# Altium schematic sheet LED_Section.SchDoc
size 420 x 297 mm; DocumentNumber: 14; SheetNumber: 14; SheetTotal: 17
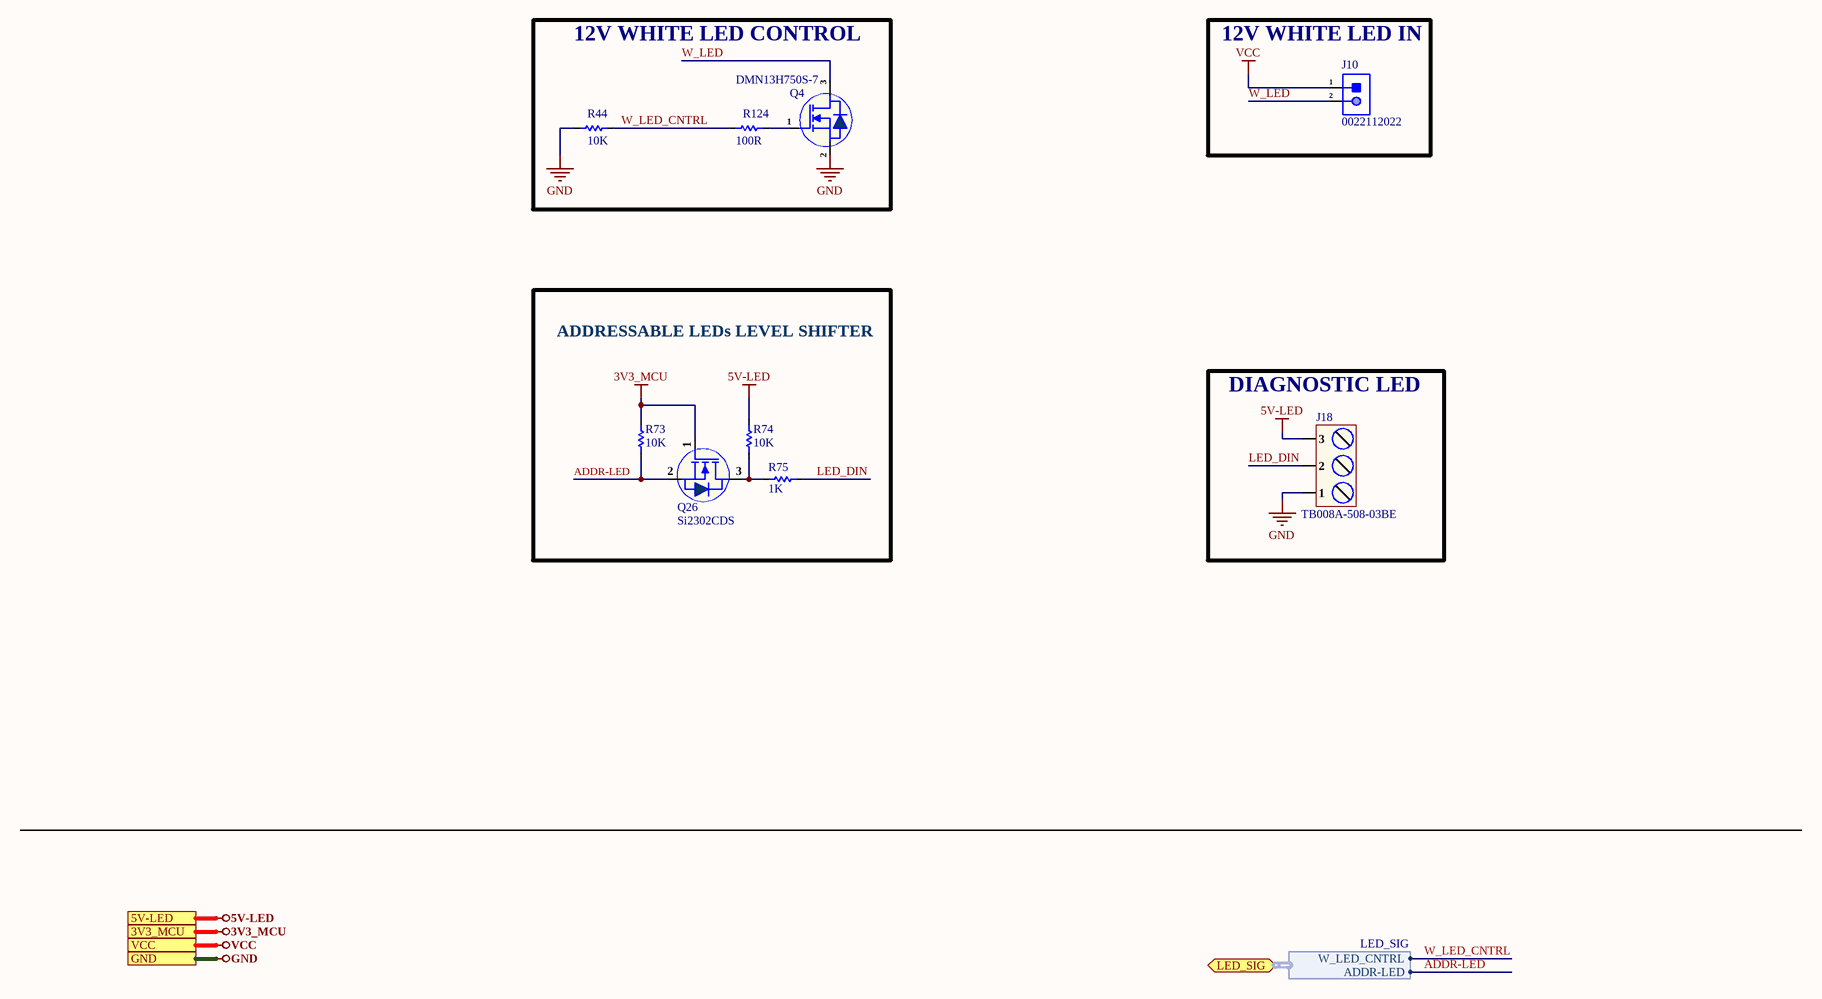
[diagram p0: LED_Section.SchDoc]

## Parts
J10  0022112022  [0022112022]
J18  TB008A-508-03BE  [TB008A-508-03BE]
Q4  DMN13H750S-7  [SOT-23]
Q26  Si2302CDS  [Sot-23]
R44  10K  [Res-0603]
R73  10K  [Res-0402]
R74  10K  [Res-0402]
R75  1K  [Res-0603]
R124  100R  [Res-0603]

## Blocks framed on the sheet
12V WHITE LED CONTROL: Q4 R44 R124
12V WHITE LED IN: J10
ADDRESSABLE LEDs LEVEL SHIFTER: Q26 R73-R75
DIAGNOSTIC LED: J18

## Ports
3V3_MCU, 5V-LED, GND, LED_SIG (bidir, harness LED_SIG), VCC

## Harnesses
LED_SIG: ADDR-LED, W_LED_CNTRL

## Nets
3V3_MCU: Q26.1(G) R73.1 ; port 3V3_MCU
5V-LED: J18.3 R74.1 ; port 5V-LED
GND: J18.1 Q4.2(S) R44.1 ; port GND
VCC: J10.1 ; port VCC
ADDR-LED: Q26.2(S) R73.2 ; port LED_SIG.ADDR-LED
LED_DIN: J18.2 R75.2
W_LED: J10.2 Q4.3(D)
W_LED_CNTRL: R44.2 R124.1 ; port LED_SIG.W_LED_CNTRL
NetQ4_1: Q4.1(G) R124.2
NetQ26_3: Q26.3(D) R74.2 R75.1

## Notes on the sheet
- File:
- Title:
- Date:
- Page
- Num:
- Total:
- Drawn By: Huzaifa Ali

## Library data of the parts
J10 = 0022112022: CONN HEADER VERT 2POS 2.54MM; Manufacturer: Molex; Item Type: Headers, Male Pins; Supplier: Mouser; Supplier Part Number: 538-22-11-2022; Manufacturer Part Number: 0022112022; RoHS: Yes; Stock: 67872; Pricing: 1=0.4, 10=0.274, 50=0.274, 100=0.216, 1000=0.177, 10000=0.169 (USD); ComponentLink1URL: https://www.molex.com/pdm_docs/sd/022112022_sd.pdf?src-supplier=Digikey; ComponentLink1Description: https://www.molex.com/pdm_docs/sd/022112022_sd.pdf?src-supplier=Digikey; LCSC Part Number: C505162
J18 = TB008A-508-03BE: TERMINAL BLOCK, SCREW TYPE, 5.08; Manufacturer: Same Sky; Item Type: Terminal Blocks; Approvals: CE, IEC, UL, cUL; Current Rating: 16A; Number of Contacts: 3; Number of Levels: 1; Pitch: 5.08mm; Voltage Rating: 300V; Wire/Cable Gauge: 12AWG; Supplier: DigiKey; Supplier Part Number: 102-6214-ND; Manufacturer Part Number: TB008A-508-03BE; RoHS: Compliant; Stock: 16509; Pricing: 1=0.88, 10=0.646, 25=0.5624, 50=0.5068, 100=0.4587, 250=0.40648, 800=0.35708, 1600=0.33523, 5600=0.30675 (USD); Color: Blue; Height: 15.82mm; Lifecycle Status: Production; Max Operating Temperature: 105°C; Min Operating Temperature: -40°C; Mounting Technology: Screw; Number of Rows: 1; Width: 13.89mm; ComponentLink1URL: https://datasheet.octopart.com:443/TB008A-508-03BE-Same-Sky-datasheet-181920260.pdf?src-supplier=Same+Sky; ComponentLink1Description: https://datasheet.octopart.com:443/TB008A-508-03BE-Same-Sky-datasheet-181920260.pdf?src-supplier=Same+Sky; ComponentLink2URL: https://datasheet.octopart.com:443/TB008A-508-03BE-CUI-Devices-datasheet-175928141.pdf?src-supplier=Same+Sky; ComponentLink2Description: https://datasheet.octopart.com:443/TB008A-508-03BE-CUI-Devices-datasheet-175928141.pdf?src-supplier=Same+Sky; ComponentLink3URL: https://datasheet.octopart.com:443/TB008A-508-03BE-CUI-Devices-datasheet-144794964.pdf?src-supplier=Same+Sky; ComponentLink3Description: https://datasheet.octopart.com:443/TB008A-508-03BE-CUI-Devices-datasheet-144794964.pdf?src-supplier=Same+Sky; ComponentLink4URL: https://datasheet.octopart.com:443/TB008A-508-03BE-CUI-Devices-datasheet-180438533.pdf?src-supplier=IHS; ComponentLink4Description: https://datasheet.octopart.com:443/TB008A-508-03BE-CUI-Devices-datasheet-180438533.pdf?src-supplier=IHS; ComponentLink5URL: https://datasheet.octopart.com:443/TB008A-508-03BE-Same-Sky-datasheet-182881448.pdf?src-supplier=Electro+Sonic; ComponentLink5Description: https://datasheet.octopart.com:443/TB008A-508-03BE-Same-Sky-datasheet-182881448.pdf?src-supplier=Electro+Sonic; ComponentLink6URL: https://datasheet.octopart.com:443/TB008A-508-03BE-CUI-Devices-datasheet-154730749.pdf?src-supplier=Electro+Sonic; ComponentLink6Description: https://datasheet.octopart.com:443/TB008A-508-03BE-CUI-Devices-datasheet-154730749.pdf?src-supplier=Electro+Sonic; ComponentLink7URL: https://datasheet.octopart.com:443/TB008A-508-03BE-Same-Sky-datasheet-182050257.pdf?src-supplier=Future+Electronics; ComponentLink7Description: https://datasheet.octopart.com:443/TB008A-508-03BE-Same-Sky-datasheet-182050257.pdf?src-supplier=Future+Electronics; ComponentLink8URL: https://datasheet.octopart.com:443/TB008A-508-03BE-CUI-Devices-datasheet-175927974.pdf?src-supplier=CUI+Devices+SCT; ComponentLink8Description: https://datasheet.octopart.com:443/TB008A-508-03BE-CUI-Devices-datasheet-175927974.pdf?src-supplier=CUI+Devices+SCT; ComponentLink9URL: https://datasheet.octopart.com:443/TB008A-508-03BE-CUI-Devices-datasheet-142371924.pdf?src-supplier=CUI+Devices+SCT; ComponentLink9Description: https://datasheet.octopart.com:443/TB008A-508-03BE-CUI-Devices-datasheet-142371924.pdf?src-supplier=CUI+Devices+SCT; ComponentLink10URL: https://octopart.com:443/opatz8j6/c1?t=0rrj9xZvWnV357ApMC44QDMfuFQOynKpDDkNDVK0ahZLtLs4EP94JWsSV65SUkEP0h5KCd_75-IqVeGeieU7iHhVKoVGG_ST2MghvEpmPJJ9UwSaEZlWiAicsgfGzyF6p2K7XALTRwBG0Ty4NiqOExgubdlPVcXLSurspFP3-kkStU3AXD7cVH-wG37lyG-DMiy0SjRNsbn3p3EEcBKBnHJR4FcTeCr9kuJyRmp0FirPwd5r7ApjQGrAVbySJS4dG70ZpeJlDibjpeCbOjvVoVjF_GpDk4_zPnX3kvvewE3aS3sxHdEwY7nG3-liKoGc8vQOYvj7q83gsACr679Us3Zzk60XfasVTe-rguoy&src-supplier=Compliance+Statements; ComponentLink10Description: https://octopart.com:443/opatz8j6/c1?t=0rrj9xZvWnV357ApMC44QDMfuFQOynKpDDkNDVK0ahZLtLs4EP94JWsSV65SUkEP0h5KCd_75-IqVeGeieU7iHhVKoVGG_ST2MghvEpmPJJ9UwSaEZlWiAicsgfGzyF6p2K7XALTRwBG0Ty4NiqOExgubdlPVcXLSurspFP3-kkStU3AXD7cVH-wG37lyG-DMiy0SjRNsbn3p3EEcBKBnHJR4FcTeCr9kuJyRmp0FirPwd5r7ApjQGrAVbySJS4dG70ZpeJlDibjpeCbOjvVoVjF_GpDk4_zPnX3kvvewE3aS3sxHdEwY7nG3-liKoGc8vQOYvj7q83gsACr679Us3Zzk60XfasVTe-rguoy&src-supplier=Compliance+Statements; ComponentLink11URL: https://octopart.com:443/opatz8j6/c1?t=QS2-Fn7cVgScLTi3gc2amca8hkcDZURPxy_ufMpeWk7uDUOdZkBCM46dERNIiGtSLWu2wlNRTRepa-5uYmvtZcTDBcRMj_nqdKYMuQtHO2A9XO5ZFvN9gYSVnieHinURU49v_SsHn50d_2pstAo6QmU6vYWW3cDtDfPq0v_nUK0JS9qffyN9Fg9TL0Vgxr7HkZJEWT4c7sY1BjN1ed2EPEv_llxnI4pfCrS9yqvKD-CsnhCPh-IFUypFb3nwWXrNmBrlKIj7KynvaUzKgM_siwj2SFGWog8hEoQA4AvTYP1Xr6oPuMWRsc8wW1c5tie0zdhqU94a6qk1TN0BgFfGzjlF53KmXw7CvFlzBL4ehZm6sg&src-supplier=Compliance+Statements; ComponentLink11Description: https://octopart.com:443/opatz8j6/c1?t=QS2-Fn7cVgScLTi3gc2amca8hkcDZURPxy_ufMpeWk7uDUOdZkBCM46dERNIiGtSLWu2wlNRTRepa-5uYmvtZcTDBcRMj_nqdKYMuQtHO2A9XO5ZFvN9gYSVnieHinURU49v_SsHn50d_2pstAo6QmU6vYWW3cDtDfPq0v_nUK0JS9qffyN9Fg9TL0Vgxr7HkZJEWT4c7sY1BjN1ed2EPEv_llxnI4pfCrS9yqvKD-CsnhCPh-IFUypFb3nwWXrNmBrlKIj7KynvaUzKgM_siwj2SFGWog8hEoQA4AvTYP1Xr6oPuMWRsc8wW1c5tie0zdhqU94a6qk1TN0BgFfGzjlF53KmXw7CvFlzBL4ehZm6sg&src-supplier=Compliance+Statements; ComponentLink12URL: https://octopart.com:443/opatz8j6/c1?t=cyoWsWJutaiKY4D4cZoL0JarVp02apWsKQY4NMaC_BE3UJrSc7HgjnBE63-W5Pn3S4_g4vPr15bqLDCh9Kdy1pQHDZsPdGVe6Y17R7O6qne0lGuhCV-OGjIpyeEMzqMXgfQMIjm1O6wLlTAkFYZD2itvYMrtCCtPfYGisoBpRwuOKSv1yQr4oma4_lISgw22SiyJjR_s1lWD_F_4tIiIW_JEvyY1YL8DvhWh7elvZo24VmfoXm02xBN4o6hon_hJ0NPFBKp0gHsFHICkCCvfugy3c62vK1nRV6pqlxkvXj8qYEFwt-V-HKimgzD_l48qCDPECTrxyE5VhV0V4OD2MUAtfA9rF-aDjXbb3Kk4&src-supplier=Compliance+Statements; ComponentLink12Description: https://octopart.com:443/opatz8j6/c1?t=cyoWsWJutaiKY4D4cZoL0JarVp02apWsKQY4NMaC_BE3UJrSc7HgjnBE63-W5Pn3S4_g4vPr15bqLDCh9Kdy1pQHDZsPdGVe6Y17R7O6qne0lGuhCV-OGjIpyeEMzqMXgfQMIjm1O6wLlTAkFYZD2itvYMrtCCtPfYGisoBpRwuOKSv1yQr4oma4_lISgw22SiyJjR_s1lWD_F_4tIiIW_JEvyY1YL8DvhWh7elvZo24VmfoXm02xBN4o6hon_hJ0NPFBKp0gHsFHICkCCvfugy3c62vK1nRV6pqlxkvXj8qYEFwt-V-HKimgzD_l48qCDPECTrxyE5VhV0V4OD2MUAtfA9rF-aDjXbb3Kk4&src-supplier=Compliance+Statements; ComponentLink13URL: https://octopart.com:443/opatz8j6/c1?t=8RiZ5SNhMWXaXunRuWXjRrkE_b-hdCS3ymm5Sp3ae4uMqMsgoglAm7-BokWdzGAZbjUMtMVCNs51B0YlYrbtv79WJFiWtC9ngkNzLFs6rEylWaaKTtmgObrPhEzzoWxuSaEtijQdV5hEKXCF5RCq7ul8L8pfufVaq0s6-bSSR6C0VjpwGz9J1Vm1NeUveBP9k9PQz8XM83TOsrC0krs8t2vDYF5-Plj7lSJMQKYpUs9gso0V1VxvtiA0EiiOXXXqxPBX1Nhh2iSdlSBOUfMvfGOGuL6ftneEugiPJhc8tqAy_YDUVjzciq62IpSvI32od9s84jAfWfTC2oKzUfjFVLX6dTtMUD249xixiYNDTNJnsQ&src-supplier=Compliance+Statements; ComponentLink13Description: https://octopart.com:443/opatz8j6/c1?t=8RiZ5SNhMWXaXunRuWXjRrkE_b-hdCS3ymm5Sp3ae4uMqMsgoglAm7-BokWdzGAZbjUMtMVCNs51B0YlYrbtv79WJFiWtC9ngkNzLFs6rEylWaaKTtmgObrPhEzzoWxuSaEtijQdV5hEKXCF5RCq7ul8L8pfufVaq0s6-bSSR6C0VjpwGz9J1Vm1NeUveBP9k9PQz8XM83TOsrC0krs8t2vDYF5-Plj7lSJMQKYpUs9gso0V1VxvtiA0EiiOXXXqxPBX1Nhh2iSdlSBOUfMvfGOGuL6ftneEugiPJhc8tqAy_YDUVjzciq62IpSvI32od9s84jAfWfTC2oKzUfjFVLX6dTtMUD249xixiYNDTNJnsQ&src-supplier=Compliance+Statements
Q4 = DMN13H750S-7: MOSFET N-CH 130V 1A SOT23; Manufacturer: Diodes Incorporated; Manufacturer Part Number: DMN13H750S-7; Package: SOT-23-3L; LCSC Part Number: C156273; Item Type: Mosfet; ComponentLink1URL: https://www.lcsc.com/product-detail/MOSFETs_Diodes-Incorporated-DMN13H750S-7_C156273.html; ComponentLink1Description: LCSC
Q26 = Si2302CDS: N-CHANNEL 20-V (D-S) MOSFET; Manufacturer: TECH PUBLIC; ComponentLink1Description: LCSC; ComponentLink1URL: https://www.lcsc.com/product-detail/MOSFETs_TECH-PUBLIC-SI2302CDS_C5310968.html; Manufacturer Part Number: SI2302CDS; Package: SOT-23; LCSC Part Number: C5310968; Item Type: Mosfet
R44 = RC0603FR-0710KL: RES SMD 10K Ohm 1% 1/10W 0603; Manufacturer: Yageo; Resistance: 10kR; Temperature Coefficient: 100ppm/°C; Voltage Rating (DC): 50V; Power Rating: 100mW; Voltage Rating: 75V; Item Type: Resistor; Supplier 1: Digi-Key; Manufacturer Part Number: RC0603FR-0710KL; RoHS: Yes; Category: Chip SMD Resistors; Stock 1: 25249139; Pricing 1: 1=0.10000, 10=0.02400, 100=0.00970, 1000=0.00436, 2500=0.00378 (USD); Case/Package: 0603; Number of Pins: 2; Case Code (Imperial): 0603; Case Code (Metric): 1608; Weight: 7.1E-05oz; Size Code: 0603; Min Operating Temperature: -55°C; Max Operating Temperature: 155°C; Tolerance: 1%; Resistor Type: Thick Film; Packaging: Tape and Reel; Termination: SMD/SMT; Features: Moisture Resistant; Series: RC; Max Power Dissipation: 100mW; Number of Terminations: 2; Resistance Tolerance: 1%; Construction: Rectangular; Length: 1.6mm; Width: 0.8mm; Height: 0.45mm; Depth: 0.8mm; Lead Pitch: 0.3mm; REACH SVHC: Unknown; Lead Free: Lead Free; Military Standard: Not; RoHS Compliant: Yes; ComponentLink1URL: https://datasheet.ciiva.com/7660/38590-7660789.pdf?src-supplier=Element14; ComponentLink1Description: https://datasheet.ciiva.com/7660/38590-7660789.pdf?src-supplier=Element14; ComponentLink2URL: https://datasheet.ciiva.com/7983/443971-7983596.pdf?src-supplier=Element14; ComponentLink2Description: https://datasheet.ciiva.com/7983/443971-7983596.pdf?src-supplier=Element14; ComponentLink3URL: https://datasheet.ciiva.com/22747/443971-22747519.pdf?src-supplier=Element14; ComponentLink3Description: https://datasheet.ciiva.com/22747/443971-22747519.pdf?src-supplier=Element14; ComponentLink4URL: https://datasheet.ciiva.com/46440/1868787-46440891.pdf?src-supplier=Element14; ComponentLink4Description: https://datasheet.ciiva.com/46440/1868787-46440891.pdf?src-supplier=Element14; ComponentLink5URL: https://datasheet.ciiva.com/7746/1738695-7746239.pdf?src-supplier=Element14; ComponentLink5Description: https://datasheet.ciiva.com/7746/1738695-7746239.pdf?src-supplier=Element14; ComponentLink6URL: https://datasheet.ciiva.com/15189/getdatasheetpartid-409289-15189591.pdf?src-supplier=Verical; ComponentLink6Description: https://datasheet.ciiva.com/15189/getdatasheetpartid-409289-15189591.pdf?src-supplier=Verical; Supplier Part Number 1: 311-10.0KHRCT-ND; LCSC Part Number: C98220
R73 R74 = RC0402FR-0710KL: RES 10K OHM 1% 1/16W 0402; Manufacturer: Yageo; Resistance: 10kR; Voltage Rating (DC): 50V; Temperature Coefficient: 100ppm/°C; Power Rating: 62.5mW; Max Power Dissipation: 63mW; Item Type: Resistor; Supplier 1: Mouser; Manufacturer Part Number: RC0402FR-0710KL; RoHS: Yes; Category: Chip SMD Resistors; Stock 1: 18648329; Pricing 1: 1=0.10000, 10=0.01400, 50=0.01400, 100=0.00500, 1000=0.00300, 10000=0.00200 (USD); Case/Package: 0402; Number of Pins: 2; Case Code (Imperial): 0402; Case Code (Metric): 1005; Min Operating Temperature: -55°C; Max Operating Temperature: 155°C; Resistor Type: Thick Film; Tolerance: 1%; Packaging: Tape and Reel; Voltage Rating: 50V; Termination: SMD/SMT; Working Voltage: 50V; Number of Terminations: 2; Features: Moisture Resistant; Series: RC; Resistance Tolerance: 1%; Construction: Rectangular; Length: 1mm; Width: 0.5mm; Height: 0.32mm; Depth: 0.5mm; Lead Pitch: 0.2mm; REACH SVHC: No SVHC; Lead Free: Lead Free; RoHS Compliant: Yes; Military Standard: Not; ComponentLink1URL: https://datasheet.ciiva.com/7660/38568-7660787.pdf?src-supplier=Element14; ComponentLink1Description: https://datasheet.ciiva.com/7660/38568-7660787.pdf?src-supplier=Element14; ComponentLink2URL: https://datasheet.ciiva.com/7849/1686128-7849814.pdf?src-supplier=Element14; ComponentLink2Description: https://datasheet.ciiva.com/7849/1686128-7849814.pdf?src-supplier=Element14; ComponentLink3URL: https://datasheet.ciiva.com/7983/1018594-7983486.pdf?src-supplier=Element14; ComponentLink3Description: https://datasheet.ciiva.com/7983/1018594-7983486.pdf?src-supplier=Element14; ComponentLink4URL: https://datasheet.ciiva.com/22747/1018594-22747512.pdf?src-supplier=Element14; ComponentLink4Description: https://datasheet.ciiva.com/22747/1018594-22747512.pdf?src-supplier=Element14; ComponentLink5URL: https://datasheet.ciiva.com/12667/pyu-rc0402-51-rohs-l-6-r-12667067.pdf?src-supplier=Mouser; ComponentLink5Description: https://datasheet.ciiva.com/12667/pyu-rc0402-51-rohs-l-6-r-12667067.pdf?src-supplier=Mouser; ComponentLink6URL: https://datasheet.ciiva.com/7849/1784430-7849813.pdf?src-supplier=Element14; ComponentLink6Description: https://datasheet.ciiva.com/7849/1784430-7849813.pdf?src-supplier=Element14; ComponentLink7URL: https://datasheet.ciiva.com/7849/1784430-7849815.pdf?src-supplier=Element14; ComponentLink7Description: https://datasheet.ciiva.com/7849/1784430-7849815.pdf?src-supplier=Element14; Supplier Part Number 1: 603-RC0402FR-0710KL; LCSC Part Number: C60490
R75 = RC0603FR-071KL: RES SMD 1K OHM 1% 1/10W 0603; Manufacturer: Yageo; Resistance: 1kR; Temperature Coefficient: 100ppm/°C; Power Rating: 100mW; Voltage Rating: 50V; Item type: Resistor; ComponentLink1URL: https://www.verical.com/server-webapp/html/getDatasheet?partID=409289&src-supplier=Verical; ComponentLink1Description: https://www.verical.com/server-webapp/html/getDatasheet?partID=409289&src-supplier=Verical; Supplier 1: Digi-Key; Manufacturer Part Number: RC0603FR-071KL; Stock 1: 21472395; Pricing 1: 1=0.1, 10=0.023, 100=0.0094, 1000=0.0042, 2500=0.0037 (USD); Case/Package: 0603; Contact Plating: Tin,Matte; Case Code (Imperial): 0603; Case Code (Metric): 1608; Min Operating Temperature: -55°C; Max Operating Temperature: 155°C; Tolerance: 1%; Composition: Thick Film; Packaging: Tape and Reel; Termination: SMD/SMT; Military Standard: Not; Length: 1.6mm; Height: 0.45mm; Depth: 0.8mm; Radiation Hardening: No; REACH SVHC: No SVHC; Lead Free: Lead Free; ComponentLink2URL: http://documents.rs-components.com/techlib://itc_doclist_GB.htm?stockno=5048928&src-supplier=RSComponents; ComponentLink2Description: http://documents.rs-components.com/techlib://itc_doclist_GB.htm?stockno=5048928&src-supplier=RSComponents; ComponentLink3URL: http://www.yageo.com/documents/recent/PYu-RC0603_51_RoHS_L_4.pdf?src-supplier=Avnet+Europe; ComponentLink3Description: http://www.yageo.com/documents/recent/PYu-RC0603_51_RoHS_L_4.pdf?src-supplier=Avnet+Europe; ComponentLink4URL: http://www.farnell.com/datasheets/2167052.pdf?src-supplier=Element14; ComponentLink4Description: http://www.farnell.com/datasheets/2167052.pdf?src-supplier=Element14; ComponentLink5URL: http://www.farnell.com/datasheets/1868787.pdf?src-supplier=Element14; ComponentLink5Description: http://www.farnell.com/datasheets/1868787.pdf?src-supplier=Element14; ComponentLink6URL: http://www.yageo.com/documents/recent/PYu-RC_Group_51_RoHS_L_2.pdf?src-supplier=Avnet; ComponentLink6Description: http://www.yageo.com/documents/recent/PYu-RC_Group_51_RoHS_L_2.pdf?src-supplier=Avnet; ComponentLink7URL: https://www.verical.com/server-webapp/html/getDatasheet?partID=404327&src-supplier=Verical; ComponentLink7Description: https://www.verical.com/server-webapp/html/getDatasheet?partID=404327&src-supplier=Verical; ComponentLink8URL: http://www.farnell.com/datasheets/443971.pdf?src-supplier=Element14; ComponentLink8Description: http://www.farnell.com/datasheets/443971.pdf?src-supplier=Element14; Supplier Part Number 1: 311-1.00KHRDKR-ND; LCSC Part Number: C22548
R124 = RC0603FR-07100RL: RES SMD 100 OHM 1% 1/10W 0603; Manufacturer: Yageo; Temperature Coefficient: 100ppm/°C; Voltage Rating (DC): 50V; Power Rating: 100mW; Item Type: Resistor; Supplier 1: Arrow Electronics; Manufacturer Part Number: RC0603FR-07100RL; RoHS: Yes; Category: Chip SMD Resistors; Stock 1: 3800000; Pricing 1: 5000=0.00300, 5000=0.00200, 5000=0.00450, 50000=0.00410, 500000=0.00230, 2500000=0.00140 (USD); Case/Package: 0603; Number of Pins: 2; Case Code (Imperial): 0603; Case Code (Metric): 1608; Size Code: 0603; Min Operating Temperature: -55°C; Max Operating Temperature: 155°C; Resistance: 100R; Tolerance: 1%; Resistor Type: Thick Film; Packaging: Tape and Reel; Voltage Rating: 50V; Termination: SMD/SMT; Features: Moisture Resistant; Series: RC; Max Power Dissipation: 100mW; Number of Terminations: 2; Construction: Rectangular; Resistance Tolerance: 1%; Technology: THICK FILM; Length: 1.6mm; Width: 0.8mm; Height: 0.45mm; Depth: 0.8mm; REACH SVHC: Unknown; Lead Free: Lead Free; RoHS Compliant: Yes; Military Standard: Not; Supplier Part Number 1: RC0603FR-07100RL; LCSC Part Number: C105588